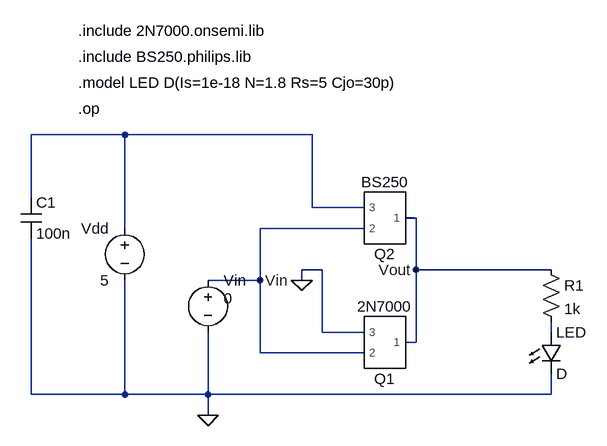
[diagram p0: schematic Draft4.asc]
Draft4.asc, the LTspice schematic file:
Version 4.1
SHEET 1 1016 680
WIRE -224 -192 -368 -192
WIRE 64 -192 -224 -192
WIRE -368 -96 -368 -192
WIRE 64 -80 64 -192
WIRE 144 -80 64 -80
WIRE 224 -64 208 -64
WIRE -224 -48 -224 -192
WIRE 144 -48 -16 -48
WIRE 80 16 48 16
WIRE 224 16 224 -64
WIRE 432 16 224 16
WIRE -16 32 -16 -48
WIRE -16 32 -96 32
WIRE 48 32 48 16
WIRE 80 112 80 16
WIRE 144 112 80 112
WIRE 432 112 432 96
WIRE 224 128 224 16
WIRE 224 128 208 128
WIRE -16 144 -16 32
WIRE 144 144 -16 144
WIRE -368 208 -368 -32
WIRE -224 208 -224 32
WIRE -224 208 -368 208
WIRE -96 208 -96 112
WIRE -96 208 -224 208
WIRE 432 208 432 176
WIRE 432 208 -96 208
WIRE -96 240 -96 208
FLAG 48 32 0
FLAG 224 16 Vout
FLAG -96 240 0
FLAG -16 32 Vin
SYMBOL 2N7000 176 128 R180
SYMATTR InstName Q1
SYMBOL BS250 176 -64 R180
SYMATTR InstName Q2
SYMBOL voltage -224 -64 M0
WINDOW 123 0 0 Left 0
WINDOW 39 0 0 Left 0
SYMATTR InstName Vdd
SYMATTR Value 5
SYMBOL res 416 0 R0
SYMATTR InstName R1
SYMATTR Value 1k
SYMBOL voltage -96 16 R0
WINDOW 3 24 44 Left 2
WINDOW 123 0 0 Left 0
WINDOW 39 0 0 Left 0
SYMATTR Value 0
SYMATTR InstName Vin
SYMBOL LED 416 112 R0
SYMATTR InstName LED
SYMBOL cap -384 -96 R0
SYMATTR InstName C1
SYMATTR Value 100n
TEXT -296 -272 Left 2 !.model LED D(Is=1e-18 N=1.8 Rs=5 Cjo=30p)
TEXT -296 -312 Left 2 !.include BS250.philips.lib
TEXT -296 -352 Left 2 !.include 2N7000.onsemi.lib
TEXT -296 -232 Left 2 !.op

The netlist it stands for:
* Draft4.asc
X§Q1 Vout Vin 0 2N7000  ; pins 1 2 3
X§Q2 Vout Vin N001 BS250  ; pins 1 2 3
Vdd N001 0 5
R1 Vout N002 1k
Vin Vin 0 0
D§LED N002 0 D
C1 N001 0 100n
.model D D
.lib standard.dio
.model LED D(Is=1e-18 N=1.8 Rs=5 Cjo=30p)
.include BS250.philips.lib
.include 2N7000.onsemi.lib
.op
.lib 2N7000.onsemi.lib
.lib BS250.philips.lib
.backanno
.end